# Altium schematic sheet a0206-2006.12.SchDoc
size 558 x 431 mm
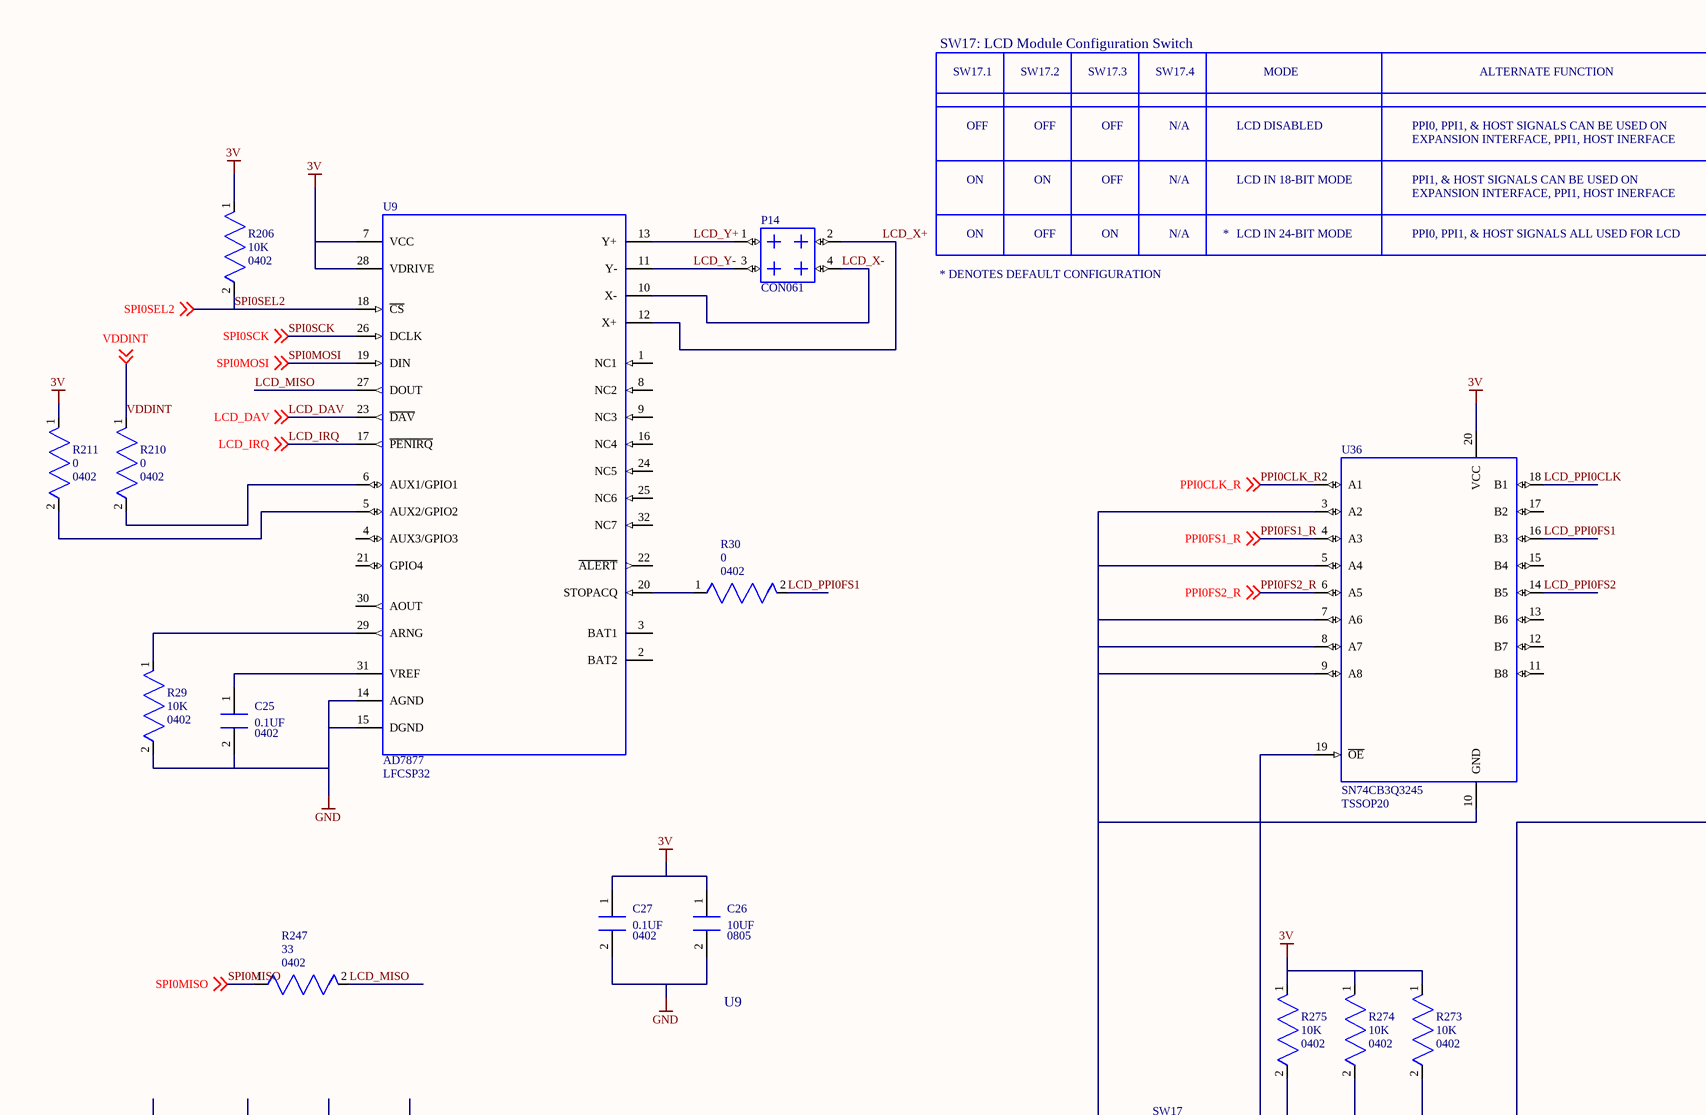
[diagram p0: a0206-2006.12.SchDoc, top left]
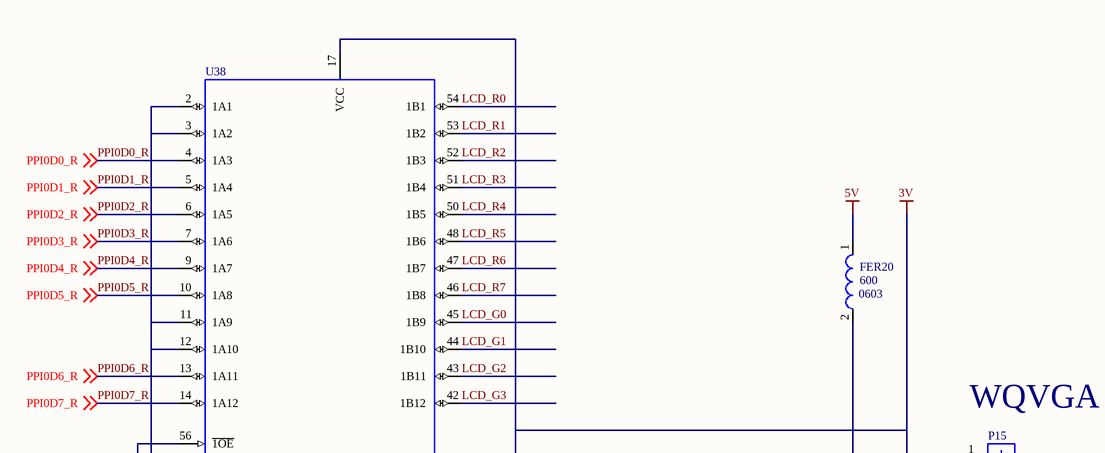
[diagram p1: a0206-2006.12.SchDoc, top right]
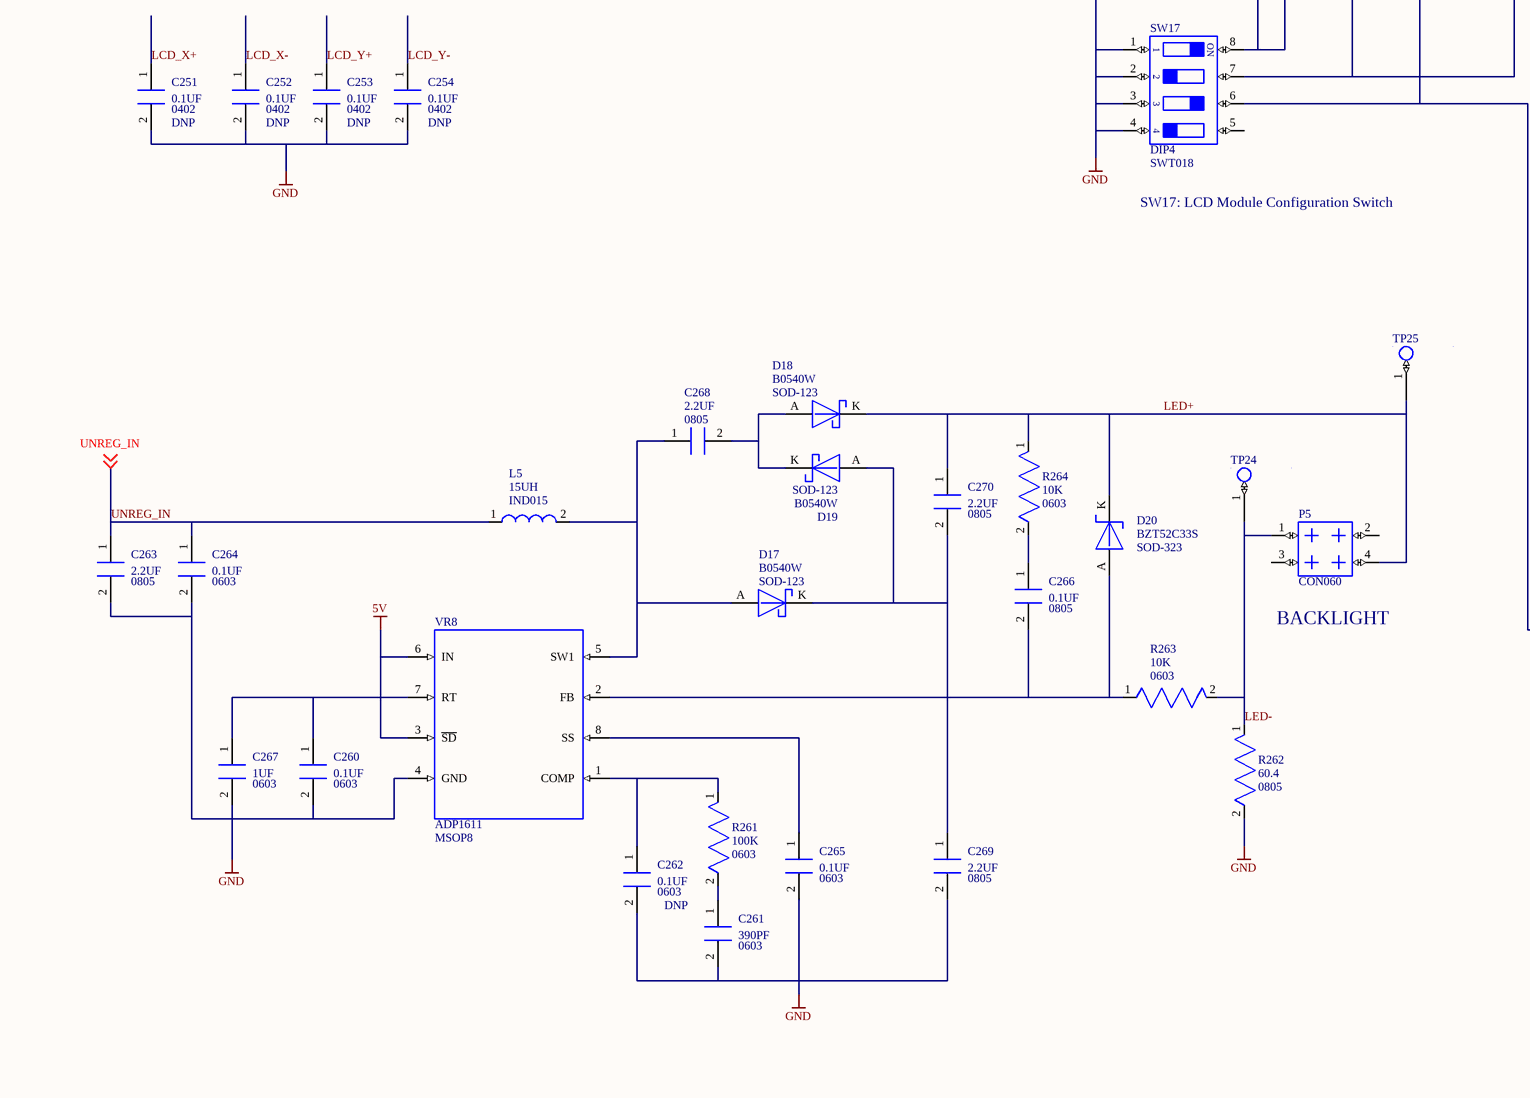
[diagram p2: a0206-2006.12.SchDoc, bottom left]
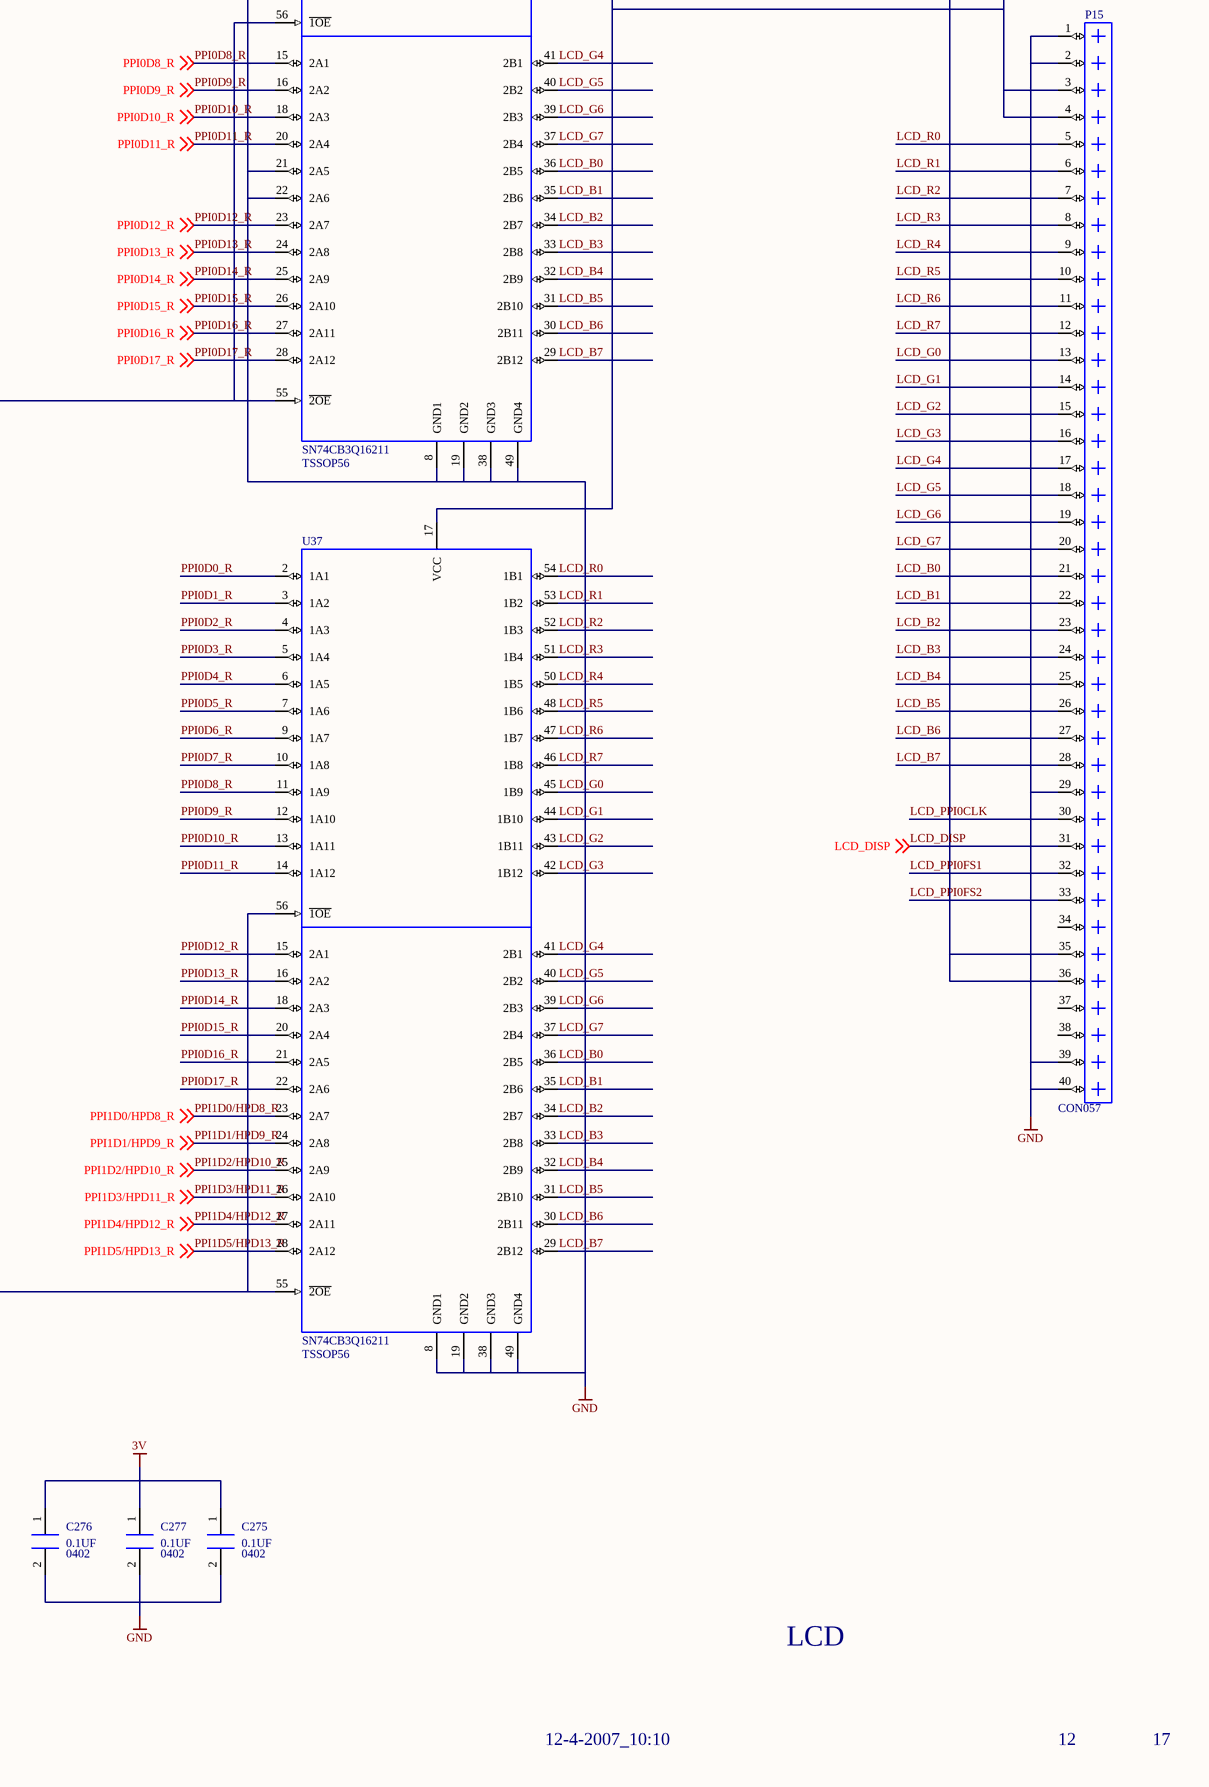
[diagram p3: a0206-2006.12.SchDoc, bottom right]

## Parts
C25  value 0.1UF  [0402]  (hidden comment: *)
C26  value 10UF  [0805]  (hidden comment: *)
C27  value 0.1UF  [0402]  (hidden comment: *)
C251  value 0.1UF  CLASS: DNP  [0402]  (hidden comment: *)
C252  value 0.1UF  CLASS: DNP  [0402]  (hidden comment: *)
C253  value 0.1UF  CLASS: DNP  [0402]  (hidden comment: *)
C254  value 0.1UF  CLASS: DNP  [0402]  (hidden comment: *)
C260  value 0.1UF  [0603]  (hidden comment: *)
C261  value 390PF  [0603]  (hidden comment: *)
C262  value 0.1UF  CLASS: DNP  [0603]  (hidden comment: *)
C263  value 2.2UF  [0805]  (hidden comment: *)
C264  value 0.1UF  [0603]  (hidden comment: *)
C265  value 0.1UF  [0603]  (hidden comment: *)
C266  value 0.1UF  [0805]  (hidden comment: *)
C267  value 1UF  [0603]  (hidden comment: *)
C268  value 2.2UF  [0805]  (hidden comment: *)
C269  value 2.2UF  [0805]  (hidden comment: *)
C270  value 2.2UF  [0805]  (hidden comment: *)
C275  value 0.1UF  [0402]  (hidden comment: *)
C276  value 0.1UF  [0402]  (hidden comment: *)
C277  value 0.1UF  [0402]  (hidden comment: *)
D17  PART: B0540W  [SOD-123]  (hidden comment: *)
D18  PART: B0540W  [SOD-123]  (hidden comment: *)
D19  PART: B0540W  [SOD-123]  (hidden comment: *)
D20  PART: BZT52C33S  [SOD-323]  (hidden comment: *)
FER20  value 600  [0603]  (hidden comment: *)
L5  value 15UH  [IND015]  (hidden comment: *)
P5  *  [CON060]  (value not drawn)
P14  *  [CON061]  (value not drawn)
P15  *  [CON057]  (value not drawn)
R29  value 10K  [0402]  (hidden comment: *)
R30  value 0  [0402]  (hidden comment: *)
R206  value 10K  [0402]  (hidden comment: *)
R210  value 0  [0402]  (hidden comment: *)
R211  value 0  [0402]  (hidden comment: *)
R247  value 33  [0402]  (hidden comment: *)
R261  value 100K  [0603]  (hidden comment: *)
R262  value 60.4  [0805]  (hidden comment: *)
R263  value 10K  [0603]  (hidden comment: *)
R264  value 10K  [0603]  (hidden comment: *)
R273  value 10K  [0402]  (hidden comment: *)
R274  value 10K  [0402]  (hidden comment: *)
R275  value 10K  [0402]  (hidden comment: *)
SW17  value DIP4  [SWT018]  (hidden comment: *)
TP24  *  [TP]  (value not drawn)
TP25  *  [TP]  (value not drawn)
U9  PART: AD7877  [LFCSP32]  (hidden comment: *)
U36  PART: SN74CB3Q3245  [TSSOP20]  (hidden comment: *)
U37  PART: SN74CB3Q16211  [TSSOP56]  (hidden comment: *)
U38  PART: SN74CB3Q16211  [TSSOP56]  (hidden comment: *)
VR8  PART: ADP1611  [MSOP8]  (hidden comment: *)

## Nets
3V: C26.1(A) C27.1(A) C275.1(A) C276.1(A) C277.1(A) P15.3 P15.4 R206.1(N1) R211.1(N1) R273.1(N1) R274.1(N1) R275.1(N1) U9.7(VCC) U9.28(VDRIVE) U36.20(VCC) U37.17(VCC) U38.17(VCC)
5V: C260.1(A) C267.1(A) FER20.1(A) VR8.3(~{SD}) VR8.6(IN) VR8.7(RT)
GND: C25.2(B) C26.2(B) C27.2(B) C251.2(B) C252.2(B) C253.2(B) C254.2(B) C260.2(B) C261.2(B) C262.2(B) C263.2(B) C264.2(B) C265.2(B) C267.2(B) C269.2(B) C275.2(B) C276.2(B) C277.2(B) P15.1 P15.2 P15.29 P15.39 P15.40 R29.2(N2) R262.2(N2) SW17.1 SW17.2 SW17.3 SW17.4 U9.14(AGND) U9.15(DGND) U9.33(GND) U36.3(A2) U36.5(A4) U36.7(A6) U36.8(A7) U36.9(A8) U36.10(GND) U37.8(GND1) U37.19(GND2) U37.38(GND3) U37.49(GND4) U38.2(1A1) U38.3(1A2) U38.8(GND1) U38.11(1A9) U38.12(1A10) U38.19(GND2) U38.21(2A5) U38.22(2A6) U38.38(GND3) U38.49(GND4) VR8.4(GND)
LCD_B0: P15.21 U37.36(2B5) U38.36(2B5)
LCD_B1: P15.22 U37.35(2B6) U38.35(2B6)
LCD_B2: P15.23 U37.34(2B7) U38.34(2B7)
LCD_B3: P15.24 U37.33(2B8) U38.33(2B8)
LCD_B4: P15.25 U37.32(2B9) U38.32(2B9)
LCD_B5: P15.26 U37.31(2B10) U38.31(2B10)
LCD_B6: P15.27 U37.30(2B11) U38.30(2B11)
LCD_B7: P15.28 U37.29(2B12) U38.29(2B12)
LCD_DAV: U9.23(~{DAV}) ; off-sheet LCD_DAV
LCD_DISP: P15.31 ; off-sheet LCD_DISP
LCD_G0: P15.13 U37.45(1B9) U38.45(1B9)
LCD_G1: P15.14 U37.44(1B10) U38.44(1B10)
LCD_G2: P15.15 U37.43(1B11) U38.43(1B11)
LCD_G3: P15.16 U37.42(1B12) U38.42(1B12)
LCD_G4: P15.17 U37.41(2B1) U38.41(2B1)
LCD_G5: P15.18 U37.40(2B2) U38.40(2B2)
LCD_G6: P15.19 U37.39(2B3) U38.39(2B3)
LCD_G7: P15.20 U37.37(2B4) U38.37(2B4)
LCD_IRQ: U9.17(~{PENIRQ}) ; off-sheet LCD_IRQ
LCD_MISO: R247.2(N2) U9.27(DOUT)
LCD_PPI0CLK: P15.30 U36.18(B1)
LCD_PPI0FS1: P15.32 R30.2(N2) U36.16(B3)
LCD_PPI0FS2: P15.33 U36.14(B5)
LCD_R0: P15.5 U37.54(1B1) U38.54(1B1)
LCD_R1: P15.6 U37.53(1B2) U38.53(1B2)
LCD_R2: P15.7 U37.52(1B3) U38.52(1B3)
LCD_R3: P15.8 U37.51(1B4) U38.51(1B4)
LCD_R4: P15.9 U37.50(1B5) U38.50(1B5)
LCD_R5: P15.10 U37.48(1B6) U38.48(1B6)
LCD_R6: P15.11 U37.47(1B7) U38.47(1B7)
LCD_R7: P15.12 U37.46(1B8) U38.46(1B8)
LCD_X+: C251.1(A) P14.2 U9.12(X+)
LCD_X-: C252.1(A) P14.4 U9.10(X-)
LCD_Y+: C253.1(A) P14.1 U9.13(Y+)
LCD_Y-: C254.1(A) P14.3 U9.11(Y-)
LED+: C270.1(A) D18.K(CATHODE) D20.K(CATHODE) P5.4 R264.1(N1) TP25.1(TP)
LED-: P5.1 R262.1(N1) R263.2(N2) TP24.1(TP)
PPI0CLK_R: U36.2(A1) ; off-sheet PPI0CLK_R
PPI0D0_R: U37.2(1A1) U38.4(1A3) ; off-sheet PPI0D0_R
PPI0D1_R: U37.3(1A2) U38.5(1A4) ; off-sheet PPI0D1_R
PPI0D2_R: U37.4(1A3) U38.6(1A5) ; off-sheet PPI0D2_R
PPI0D3_R: U37.5(1A4) U38.7(1A6) ; off-sheet PPI0D3_R
PPI0D4_R: U37.6(1A5) U38.9(1A7) ; off-sheet PPI0D4_R
PPI0D5_R: U37.7(1A6) U38.10(1A8) ; off-sheet PPI0D5_R
PPI0D6_R: U37.9(1A7) U38.13(1A11) ; off-sheet PPI0D6_R
PPI0D7_R: U37.10(1A8) U38.14(1A12) ; off-sheet PPI0D7_R
PPI0D8_R: U37.11(1A9) U38.15(2A1) ; off-sheet PPI0D8_R
PPI0D9_R: U37.12(1A10) U38.16(2A2) ; off-sheet PPI0D9_R
PPI0D10_R: U37.13(1A11) U38.18(2A3) ; off-sheet PPI0D10_R
PPI0D11_R: U37.14(1A12) U38.20(2A4) ; off-sheet PPI0D11_R
PPI0D12_R: U37.15(2A1) U38.23(2A7) ; off-sheet PPI0D12_R
PPI0D13_R: U37.16(2A2) U38.24(2A8) ; off-sheet PPI0D13_R
PPI0D14_R: U37.18(2A3) U38.25(2A9) ; off-sheet PPI0D14_R
PPI0D15_R: U37.20(2A4) U38.26(2A10) ; off-sheet PPI0D15_R
PPI0D16_R: U37.21(2A5) U38.27(2A11) ; off-sheet PPI0D16_R
PPI0D17_R: U37.22(2A6) U38.28(2A12) ; off-sheet PPI0D17_R
PPI0FS1_R: U36.4(A3) ; off-sheet PPI0FS1_R
PPI0FS2_R: U36.6(A5) ; off-sheet PPI0FS2_R
PPI1D0/HPD8_R: U37.23(2A7) ; off-sheet PPI1D0/HPD8_R
PPI1D1/HPD9_R: U37.24(2A8) ; off-sheet PPI1D1/HPD9_R
PPI1D2/HPD10_R: U37.25(2A9) ; off-sheet PPI1D2/HPD10_R
PPI1D3/HPD11_R: U37.26(2A10) ; off-sheet PPI1D3/HPD11_R
PPI1D4/HPD12_R: U37.27(2A11) ; off-sheet PPI1D4/HPD12_R
PPI1D5/HPD13_R: U37.28(2A12) ; off-sheet PPI1D5/HPD13_R
SPI0MISO: R247.1(N1) ; off-sheet SPI0MISO
SPI0MOSI: U9.19(DIN) ; off-sheet SPI0MOSI
SPI0SCK: U9.26(DCLK) ; off-sheet SPI0SCK
SPI0SEL2: R206.2(N2) U9.18(~{CS}) ; off-sheet SPI0SEL2
UNREG_IN: C263.1(A) C264.1(A) L5.1(A) ; off-sheet UNREG_IN
VDDINT: R210.1(N1) ; off-sheet VDDINT
NetC25_1: C25.1(A) U9.31(VREF)
NetC261_1: C261.1(A) R261.2(N2)
NetC262_1: C262.1(A) R261.1(N1) VR8.1(COMP)
NetC265_1: C265.1(A) VR8.8(SS)
NetC266_1: C266.1(A) R264.2(N2)
NetC266_2: C266.2(B) D20.A(ANODE) R263.1(N1) VR8.2(FB)
NetC268_1: C268.1(A) D17.A(ANODE) L5.2(B) VR8.5(SW1)
NetC268_2: C268.2(B) D18.A(ANODE) D19.K(CATHODE)
NetC269_1: C269.1(A) C270.2(B) D17.K(CATHODE) D19.A(ANODE)
NetFER20_2: FER20.2(B) P15.35 P15.36
NetR29_1: R29.1(N1) U9.29(ARNG)
NetR30_1: R30.1(N1) U9.20(STOPACQ)
NetR210_2: R210.2(N2) U9.6(AUX1/GPIO1)
NetR211_2: R211.2(N2) U9.5(AUX2/GPIO2)
NetR273_2: R273.2(N2) SW17.6 U37.55(~{2OE}) U37.56(~{1OE})
NetR274_2: R274.2(N2) SW17.7 U38.55(~{2OE}) U38.56(~{1OE})
NetR275_2: R275.2(N2) SW17.8 U36.19(~{OE})

Not connected (* = marked no-connect by the designer): P5 2 3 5 6; P14 5 6; P15 34 37 38; SW17 5; U9 1(NC1) 2(BAT2) 3(BAT1) 4(AUX3/GPIO3) 8(NC2) 9(NC3) 16(NC4) 21(GPIO4) 22(~{ALERT}) 24(NC5) 25(NC6) 30(AOUT) 32(NC7); U36 1 11(B8) 12(B7) 13(B6) 15(B4) 17(B2); U37 1; U38 1

## Notes on the sheet
- SW17: LCD Module Configuration Switch
- SW17.1
- SW17.2
- SW17.3
- SW17.4
- MODE
- ALTERNATE FUNCTION
- OFF
- N/A
- LCD DISABLED
- PPI0, PPI1, & HOST SIGNALS CAN BE USED ON
- EXPANSION INTERFACE, PPI1, HOST INERFACE
- ON
- LCD IN 18-BIT MODE
- PPI1, & HOST SIGNALS CAN BE USED ON
- * DENOTES DEFAULT CONFIGURATION
- *
- LCD IN 24-BIT MODE
- PPI0, PPI1, & HOST SIGNALS ALL USED FOR LCD
- (near P15) WQVGA
- U9
- (near P5) BACKLIGHT
- LCD
- 12-4-2007_10:10
- 12
- 17
- A
- B
- C
- D
- 1
- 2
- 3
- 20 Cotton Road
- 4
- DEVICES
- ANALOG
- Nashua, NH 03063
- PH: 1-800-ANALOGD
- Title
- ADSP-BF548 EZ-KIT LITE
- Size
- Board No.
- A0206-2006
- Rev
- 1.4B
- Date
- Sheet
- of
- (in symbol SW_DIP4.1) ON

## Library data of the parts
C25 C251 C253 C277 = CAP_NON_POLARIZED.2: PART_SPEC: CAPACITOR; LEVEL: STD; TOLERANCE: 10%; VOLTAGE: 10V; PRT_NUM: 7000278; BOARDS: BOTH; TYPE: X5R; PKG_TYPE: 0402; ROHS: ROHS
C26 = CAP_NON_POLARIZED.2: PART_SPEC: CAPACITOR; LEVEL: STD; TOLERANCE: 10%; VOLTAGE: 6.3V; PRT_NUM: 7000265; BOARDS: BOTH; TYPE: X5R; PKG_TYPE: 0805; ROHS: ROHS
C27 C252 C254 C275 C276 = CAP_NON_POLARIZED.2: PART_SPEC: CAPACITOR; LEVEL: STD; TYPE: X5R; BOARDS: BOTH; PRT_NUM: 7000278; VOLTAGE: 10V; TOLERANCE: 10%; PKG_TYPE: 0402; ROHS: ROHS
C260 C262 C264 C265 = CAP_NON_POLARIZED.2: PART_SPEC: CAPACITOR; LEVEL: STD; TOLERANCE: 10%; VOLTAGE: 16V; TYPE: X7R; PRT_NUM: 7000340; PKG_TYPE: 0603; ROHS: ROHS
C261 = CAP_NON_POLARIZED.2: PART_SPEC: CAPACITOR; LEVEL: STD; TOLERANCE: 5%; VOLTAGE: 25V; TYPE: NPO; PRT_NUM: 7000437; PKG_TYPE: 0603; ROHS: ROHS
C263 C269 C270 = CAP_NON_POLARIZED.2: PART_SPEC: CAPACITOR; LEVEL: STD; TOLERANCE: 10%; VOLTAGE: 25V; TYPE: X7R; PRT_NUM: 7000607; PKG_TYPE: 0805; ROHS: ROHS
C266 = CAP_NON_POLARIZED.2: PART_SPEC: CAPACITOR; LEVEL: STD; TOLERANCE: 10%; VOLTAGE: 50V; TYPE: X7R; PRT_NUM: 7000034; PKG_TYPE: 0805; ROHS: ROHS
C267 = CAP_NON_POLARIZED.2: PART_SPEC: CAPACITOR; LEVEL: STD; PRT_NUM: 7000574; TYPE: X5S; VOLTAGE: 50V; TOLERANCE: 10%; PKG_TYPE: 0603; ROHS: ROHS
C268 = CAP_NON_POLARIZED.1: PART_SPEC: CAPACITOR; LEVEL: STD; TOLERANCE: 10%; VOLTAGE: 25V; TYPE: X7R; PRT_NUM: 7000607; PKG_TYPE: 0805; ROHS: ROHS
D17-D19 = DIO_SCHOTTKY.1: SCHOTTKY BARRIER RECTIFIE; LEVEL: STD; CURRENT: .5A; PRT_NUM: 7000605; PKG_TYPE: SOD-123; WEB: http://www.diodes.com/products/catalog/detail.php?item-id; ROHS: ROHS
D20 = DIO_ZENER2P.1: ZENER; LEVEL: STD; CURRENT: .5A; PRT_NUM: 7000606; PKG_TYPE: SOD-323; WEB: http://www.diodes.com/products/catalog/detail.php?item-id; ROHS: ROHS
FER20 = FER_STANDARD.2: PART_SPEC: FERRITE; LEVEL: STD; CURRENT: 200MA; FREQ: 100MHZ; PRT_NUM: 7000112; PKG_TYPE: 0603; ROHS: ROHS
L5 = IND_STANDARD.1: PART_SPEC: INDUCTOR; LEVEL: STD; TOLERANCE: 20%; PRT_NUM: 7000604; PKG_TYPE: IND015; ROHS: ROHS
P5 = CON_LCD_BACKLIGHT_LQ043T3DX02.1: 0.5MM LCD CONNECTOR; NC: 5,6; LEVEL: STD; PRT_NUM: 6000837; CONFIGURATION: 4PIN; PART_SPEC: CONNECTOR; PKG_TYPE: CON060; TYPE: FPC; ROHS: ROHS
P14 = CON_LCD_TOUCH_LQ043T3DX02.1: 1.0MM LCD CONNECTOR; NC: 5,6; LEVEL: STD; CONFIGURATION: 4PIN; PRT_NUM: 6000838; PART_SPEC: CONNECTOR; PKG_TYPE: CON061; ROHS: ROHS; TYPE: FPC
P15 = CON_40X1.1: 0.5MM LCD CONNECTOR; LEVEL: STD; CONFIGURATION: 40PIN; PRT_NUM: 6000834; PART_SPEC: CONNECTOR; PKG_TYPE: CON057; ROHS: ROHS; TYPE: FPC
R29 R273 R275 = RES_STANDARD.2: PART_SPEC: RESISTOR; LEVEL: STD; PRT_NUM: 7000280; TOLERANCE: 5%; BOARDS: BOTH; POWER: 1/16W; PKG_TYPE: 0402; ROHS: ROHS
R30 = RES_STANDARD.1: PART_SPEC: RESISTOR; LEVEL: STD; PRT_NUM: 7000282; POWER: 1/16W; TOLERANCE: 5%; PKG_TYPE: 0402; ROHS: ROHS
R206 R274 = RES_STANDARD.2: PART_SPEC: RESISTOR; LEVEL: STD; POWER: 1/16W; BOARDS: BOTH; TOLERANCE: 5%; PRT_NUM: 7000280; PKG_TYPE: 0402; ROHS: ROHS
R210 = RES_STANDARD.2: PART_SPEC: RESISTOR; LEVEL: STD; POWER: 1/16W; TOLERANCE: 5%; PRT_NUM: 7000282; PKG_TYPE: 0402; ROHS: ROHS
R211 = RES_STANDARD.2: PART_SPEC: RESISTOR; LEVEL: STD; PRT_NUM: 7000282; TOLERANCE: 5%; POWER: 1/16W; PKG_TYPE: 0402; ROHS: ROHS
R247 = RES_STANDARD.1: PART_SPEC: RESISTOR; LEVEL: STD; TOLERANCE: 5%; POWER: 1/16W; PRT_NUM: 7000285; PKG_TYPE: 0402; ROHS: ROHS
R261 = RES_STANDARD.2: PART_SPEC: RESISTOR; LEVEL: STD; TOLERANCE: 5%; POWER: 1/10W; PRT_NUM: 7000367; PKG_TYPE: 0603; ROHS: ROHS
R262 = RES_STANDARD.2: PART_SPEC: RESISTOR; LEVEL: STD; PRT_NUM: 7000603; POWER: 1/8W; TOLERANCE: 1%; PKG_TYPE: 0805; ROHS: ROHS
R263 = RES_STANDARD.1: PART_SPEC: RESISTOR; LEVEL: STD; PRT_NUM: 7000364; POWER: 1/10W; TOLERANCE: 5%; PKG_TYPE: 0603; ROHS: ROHS
R264 = RES_STANDARD.2: PART_SPEC: RESISTOR; LEVEL: STD; TOLERANCE: 5%; POWER: 1/10W; PRT_NUM: 7000364; PKG_TYPE: 0603; ROHS: ROHS
SW17 = SW_DIP4.1: 4PIN-SMT-SWT; PART_SPEC: SWITCH; LEVEL: STD; PRT_NUM: 6000144; BOARDS: KIT; PKG_TYPE: SWT018; ROHS: ROHS
TP24 TP25 = MSC_TEST_POINT.1: TESTPOINT; CLASS: DNP; LEVEL: STD; PART_SPEC: TESTPOINT; PART: TESTPOINT; ROHS: ROHS; PKG_TYPE: TP
U9 = ICS_AD7877.1: TOUCH SCREEN CONTROLLER; LEVEL: STD; PRT_NUM: 30-025761-01; PKG_TYPE: LFCSP32; ROHS: ROHS; WEB: http://www.analog.com/en/prod/0%2C2877%2CAD7877%2C00.html
U36 = ICS_SN74CB3Q3245.1: 8-BIT BUS SWITCH; NC: 1; LEVEL: STD; PRT_NUM: 1000439; PKG_TYPE: TSSOP20; ROHS: ROHS; WEB: http://focus.ti.com/docs/prod/folders/print/sn74cb3q3245.html
U37 U38 = ICS_SN74CB3Q16211.1: 24-BIT BUS SWITCH; NC: 1; LEVEL: STD; PRT_NUM: 1000438; PKG_TYPE: TSSOP56; ROHS: ROHS; WEB: http://focus.ti.com/docs/prod/folders/print/sn74cb3q16211.html
VR8 = ICS_ADP1611.1: STEP-UP-DC-DC CONVERTER; LEVEL: STD; PRT_NUM: 30-025763-01; PKG_TYPE: MSOP8; WEB: http://www.analog.com/en/prod/0,,766_824_ADP1611,00.html; ROHS: ROHS